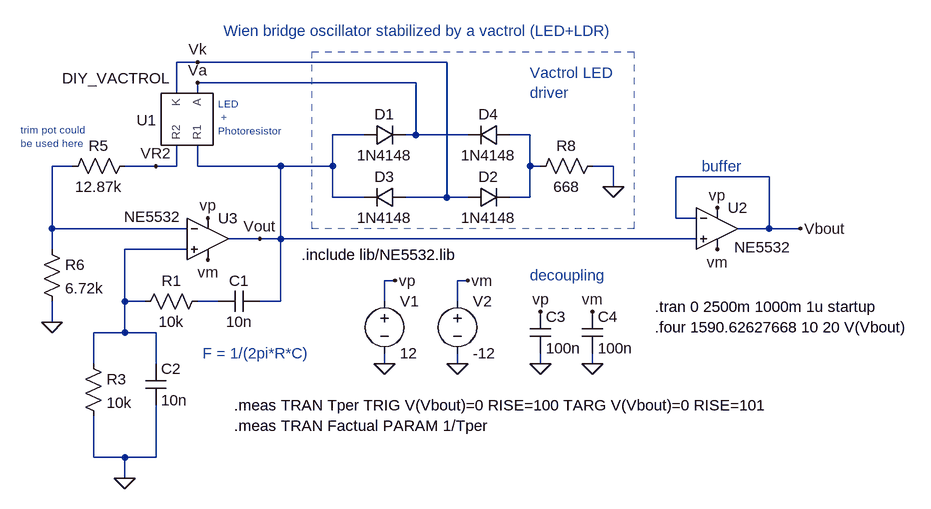
[diagram p0: schematic ne5532_diy_ldr.asc]
ne5532_diy_ldr.asc, the LTspice schematic file:
Version 4.1
SHEET 1 2520 852
WIRE 640 0 608 0
WIRE 1024 0 640 0
WIRE 976 32 640 32
WIRE 608 48 608 0
WIRE 640 48 640 32
WIRE 896 112 848 112
WIRE 976 112 976 32
WIRE 976 112 960 112
WIRE 1056 112 976 112
WIRE 1152 112 1120 112
WIRE 448 160 416 160
WIRE 576 160 528 160
WIRE 608 160 608 128
WIRE 608 160 576 160
WIRE 640 160 640 128
WIRE 768 160 640 160
WIRE 848 160 848 112
WIRE 848 160 768 160
WIRE 1152 160 1152 112
WIRE 1168 160 1152 160
WIRE 1280 160 1248 160
WIRE 1520 176 1376 176
WIRE 1280 192 1280 160
WIRE 848 208 848 160
WIRE 896 208 848 208
WIRE 1024 208 1024 0
WIRE 1024 208 960 208
WIRE 1056 208 1024 208
WIRE 1152 208 1152 160
WIRE 1152 208 1120 208
WIRE 1376 240 1376 176
WIRE 1408 240 1376 240
WIRE 416 256 416 160
WIRE 624 256 416 256
WIRE 1520 256 1520 176
WIRE 1520 256 1472 256
WIRE 1568 256 1520 256
WIRE 736 272 688 272
WIRE 768 272 768 160
WIRE 768 272 736 272
WIRE 1408 272 768 272
WIRE 416 288 416 256
WIRE 624 288 528 288
WIRE 944 336 928 336
WIRE 1056 336 1040 336
WIRE 528 368 528 288
WIRE 560 368 528 368
WIRE 672 368 640 368
WIRE 768 368 768 272
WIRE 768 368 736 368
WIRE 928 368 928 336
WIRE 1040 368 1040 336
WIRE 416 400 416 368
WIRE 528 416 528 368
WIRE 528 416 480 416
WIRE 576 416 528 416
WIRE 480 464 480 416
WIRE 576 464 576 416
WIRE 928 464 928 448
WIRE 1040 464 1040 448
WIRE 1168 464 1168 448
WIRE 1248 464 1248 448
WIRE 480 608 480 544
WIRE 528 608 480 608
WIRE 576 608 576 528
WIRE 576 608 528 608
WIRE 528 640 528 608
FLAG 656 240 vp
FLAG 656 304 vm
FLAG 1040 464 0
FLAG 928 464 0
FLAG 944 336 vp
FLAG 1056 336 vm
FLAG 528 640 0
FLAG 1568 256 Vbout
FLAG 640 0 Vk
FLAG 576 160 VR2
FLAG 1248 384 vm
FLAG 1168 384 vp
FLAG 1168 464 0
FLAG 1248 464 0
FLAG 1440 288 vm
FLAG 1440 224 vp
FLAG 416 400 0
FLAG 1280 192 0
FLAG 640 32 Va
FLAG 736 272 Vout
SYMBOL voltage 928 352 R0
WINDOW 123 0 0 Left 0
WINDOW 39 0 0 Left 0
SYMATTR InstName V1
SYMATTR Value 12
SYMBOL voltage 1040 352 R0
WINDOW 123 0 0 Left 0
WINDOW 39 0 0 Left 0
SYMATTR InstName V2
SYMATTR Value -12
SYMBOL OpAmps\\opamp2 656 208 R0
WINDOW 3 -129 30 Left 2
SYMATTR Value NE5532
SYMATTR InstName U3
SYMBOL cap 736 352 R90
WINDOW 0 0 32 VBottom 2
WINDOW 3 32 32 VTop 2
SYMATTR InstName C1
SYMATTR Value 10n
SYMBOL res 656 352 R90
WINDOW 0 0 56 VBottom 2
WINDOW 3 32 56 VTop 2
SYMATTR InstName R1
SYMATTR Value 10k
SYMBOL cap 560 464 R0
SYMATTR InstName C2
SYMATTR Value 10n
SYMBOL res 464 448 R0
SYMATTR InstName R3
SYMATTR Value 10k
SYMBOL res 432 176 R270
WINDOW 0 32 56 VTop 2
WINDOW 3 0 56 VBottom 2
SYMATTR InstName R5
SYMATTR Value 12.87k
SYMBOL res 400 272 R0
SYMATTR InstName R6
SYMATTR Value 6.72k
SYMBOL diode 896 128 R270
WINDOW 0 32 32 VTop 2
WINDOW 3 0 32 VBottom 2
SYMATTR InstName D1
SYMATTR Value 1N4148
SYMBOL diode 1056 224 R270
WINDOW 3 0 32 VBottom 2
WINDOW 0 32 32 VTop 2
SYMATTR Value 1N4148
SYMATTR InstName D2
SYMBOL diode 960 192 R90
WINDOW 0 0 32 VBottom 2
WINDOW 3 32 32 VTop 2
SYMATTR InstName D3
SYMATTR Value 1N4148
SYMBOL diode 1120 96 R90
WINDOW 0 0 32 VBottom 2
WINDOW 3 32 32 VTop 2
SYMATTR InstName D4
SYMATTR Value 1N4148
SYMBOL res 1264 144 R90
WINDOW 0 0 56 VBottom 2
WINDOW 3 32 56 VTop 2
SYMATTR InstName R8
SYMATTR Value 668
SYMBOL lib\\sub\\DIY_VACTROL 624 80 R90
WINDOW 3 -40 109 VBottom 2
WINDOW 0 -6 62 VTop 2
SYMATTR InstName U1
SYMBOL cap 1152 384 R0
SYMATTR InstName C3
SYMATTR Value 100n
SYMBOL cap 1232 384 R0
SYMATTR InstName C4
SYMATTR Value 100n
SYMBOL OpAmps\\opamp2 1440 192 R0
WINDOW 3 26 93 Left 2
SYMATTR Value NE5532
SYMATTR InstName U2
TEXT 800 296 Left 2 !.include lib/NE5532.lib
TEXT 1344 376 Left 2 !.tran 0 2500m 1000m 1u startup
TEXT 1344 408 Left 2 !.four 1590.62627668 10 20 V(Vbout)
TEXT 696 528 Left 2 !.meas TRAN Tper TRIG V(Vbout)=0 RISE=100 TARG V(Vbout)=0 RISE=101\n.meas TRAN Factual PARAM 1/Tper
TEXT 1152 328 Left 2 ;decoupling
TEXT 680 -48 Left 2 ;Wien bridge oscillator stabilized by a vactrol (LED+LDR)
TEXT 648 448 Left 2 ;F = 1/(2pi*R*C)
TEXT 1152 16 Left 2 ;Vactrol LED\ndriver
TEXT 1416 160 Left 2 ;buffer
TEXT 672 64 Left 1 ;LED\n +\nPhotoresistor
TEXT 368 104 Left 1 ;trim pot could\nbe used here
RECTANGLE Normal 1312 256 816 -16 2

The netlist it stands for:
* ne5532_diy_ldr.asc
V1 vp 0 12
V2 vm 0 -12
X§U3 N003 N002 vp vm Vout NE5532  ; pins In+ In- V+ V- OUT
C1 Vout N004 10n
R1 N004 N003 10k
C2 N003 0 10n
R3 N003 0 10k
R5 N002 VR2 12.87k
R6 N002 0 6.72k
D1 Vout Va 1N4148
D2 Vk N001 1N4148
D3 Vk Vout 1N4148
D4 N001 Va 1N4148
R8 0 N001 668
X§U1 Va Vk Vout VR2 DIY_VACTROL  ; pins A K R1 R2
C3 vp 0 100n
C4 vm 0 100n
X§U2 Vout Vbout vp vm Vbout NE5532  ; pins In+ In- V+ V- OUT
.model D D
.lib standard.dio
.include lib/NE5532.lib
.tran 0 2500m 1000m 1u startup
.four 1590.62627668 10 20 V(Vbout)
.meas TRAN Tper TRIG V(Vbout)=0 RISE=100 TARG V(Vbout)=0 RISE=101
.meas TRAN Factual PARAM 1/Tper
* decoupling
* Wien bridge oscillator stabilized by a vactrol (LED+LDR)
* F = 1/(2pi*R*C)
* Vactrol LED
* driver
* buffer
* LED
*  +
* Photoresistor
* trim pot could
* be used here
.lib lib/sub/DIY_VACTROL.sub
.backanno
.end